# Altium schematic sheet Connector_Section.SchDoc
size A4; SheetNumber: 5; SheetTotal: 5
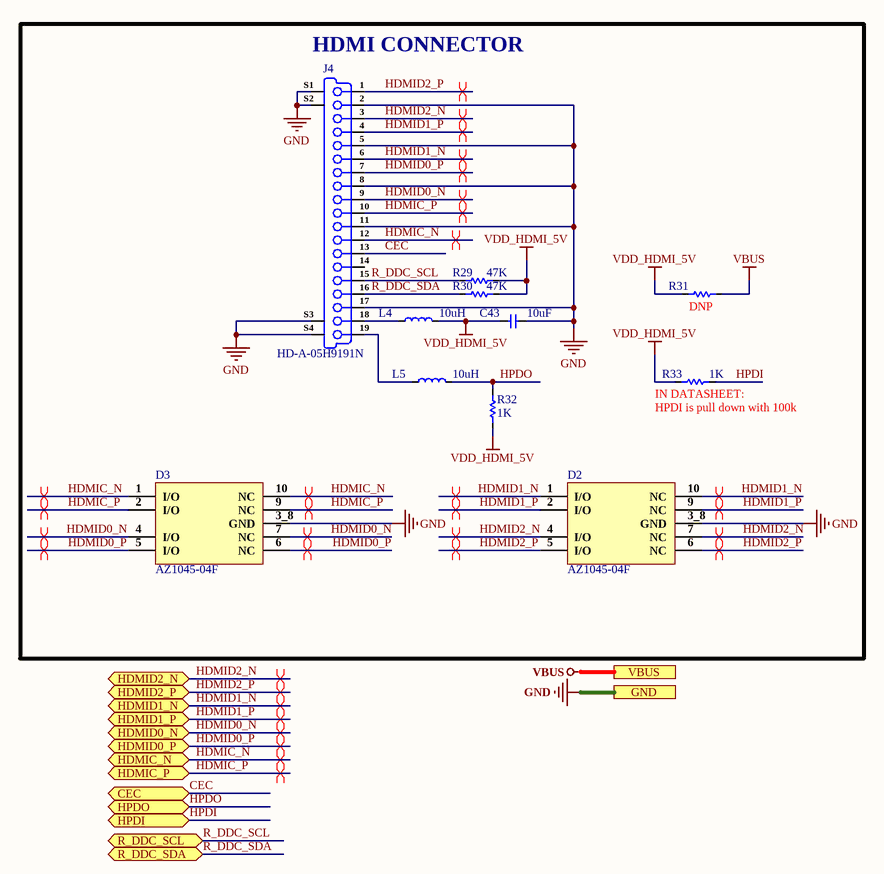
[diagram p0: Connector_Section.SchDoc]

## Parts
C43  10uF  [Cap-0603]
D2  AZ1045-04F  [AZ1045-04F]
D3  AZ1045-04F  [AZ1045-04F]
J4  HD-A-05H9191N  [HD-A-05H9191N]
L4  10uH  [IND-0603 (1608 Metric)]
L5  10uH  [IND-0603 (1608 Metric)]
R29  47K  [Res-0603]
R30  47K  [Res-0603]
R31  1K  [Res-0603]  (value not drawn)
R32  1K  [Res-0603]
R33  1K  [Res-0603]

## Ports
CEC (bidir, see Top_Sheet[3C], HDMI_to_MIPI_Section[1D]), GND (see Top_Sheet[3D], Controller_Section[1D], HDMI_to_MIPI_Section[1D], Power_Section[3C]), HDMIC_N (bidir, see Top_Sheet[3C], HDMI_to_MIPI_Section[1C]), HDMIC_P (bidir, see Top_Sheet[3C], HDMI_to_MIPI_Section[1D]), HDMID0_N (bidir, see Top_Sheet[3C], HDMI_to_MIPI_Section[1C]), HDMID0_P (bidir, see Top_Sheet[3C], HDMI_to_MIPI_Section[1C]), HDMID1_N (bidir, see Top_Sheet[3C], HDMI_to_MIPI_Section[1C]), HDMID1_P (bidir, see Top_Sheet[3C], HDMI_to_MIPI_Section[1C]), HDMID2_N (bidir, see Top_Sheet[3C], HDMI_to_MIPI_Section[1C]), HDMID2_P (bidir, see Top_Sheet[3C], HDMI_to_MIPI_Section[1C]), HPDI (bidir, see Top_Sheet[3C], HDMI_to_MIPI_Section[1D]), HPDO (bidir, see Top_Sheet[3C], HDMI_to_MIPI_Section[1D]), R_DDC_SCL (bidir, see Top_Sheet[3C], HDMI_to_MIPI_Section[1D]), R_DDC_SDA (bidir, see Top_Sheet[3C], HDMI_to_MIPI_Section[1D]), VBUS (see Top_Sheet[2C], Controller_Section[1D], Power_Section[3C])

## Nets
GND: C43.1 D2.3_8(GND) D3.3_8(GND) J4.2 J4.5 J4.8 J4.11 J4.17 J4.S1(Shield) J4.S2(Shield) J4.S3(Shield) J4.S4(Shield) ; port GND
VBUS: R31.1 ; port VBUS
VDD_HDMI_5V: C43.2 L4.2 R29.2 R30.2 R31.2 R32.2 R33.2
CEC: J4.13 ; port CEC
HDMIC_N: D3.1(I/O) D3.10(NC) J4.12 ; port HDMIC_N
HDMIC_P: D3.2(I/O) D3.9(NC) J4.10 ; port HDMIC_P
HDMID0_N: D3.4(I/O) D3.7(NC) J4.9 ; port HDMID0_N
HDMID0_P: D3.5(I/O) D3.6(NC) J4.7 ; port HDMID0_P
HDMID1_N: D2.1(I/O) D2.10(NC) J4.6 ; port HDMID1_N
HDMID1_P: D2.2(I/O) D2.9(NC) J4.4 ; port HDMID1_P
HDMID2_N: D2.4(I/O) D2.7(NC) J4.3 ; port HDMID2_N
HDMID2_P: D2.5(I/O) D2.6(NC) J4.1 ; port HDMID2_P
HPDI: R33.1 ; port HPDI
HPDO: L5.2 R32.1 ; port HPDO
R_DDC_SCL: J4.15 R29.1 ; port R_DDC_SCL
R_DDC_SDA: J4.16 R30.1 ; port R_DDC_SDA
NetJ4_18: J4.18 L4.1
NetJ4_19: J4.19 L5.1

Not connected (* = marked no-connect by the designer): J4 14

## Layout directives
differential pair; net class HDMI; differential pair class HDMI_Lines; rule Impedance Constraint [Min = 95.00    Max = 100.0    ]; rule Matched Net Lengths [Tolerance = 5mil]: HDMIC_N, HDMIC_P, HDMID0_N, HDMID0_P, HDMID1_N, HDMID1_P, HDMID2_N, HDMID2_P

## Notes on the sheet
- (near J4) HDMI CONNECTOR
- (near R31) DNP
- (near R33) IN DATASHEET:
- (near R33) HPDI is pull down with 100k
- File:
- Title:
- Date:
- Page
- Num:
- Total:
- Drawn By: Huzaifa Ali

## Library data of the parts
C43 = CGA0603X5R106K100JT: 10V 10uF X5R ±10% 0603 Multilayer Ceramic Capacitors MLCC - SMD/SMT ROHS; Manufacturer: HRE; ComponentLink1Description: LCSC; ComponentLink1URL: https://www.lcsc.com/product-detail/Multilayer-Ceramic-Capacitors-MLCC-SMD-SMT_HRE-CGA0603X5R106K100JT_C6119842.html; Manufacturer Part Number: CGA0603X5R106K100JT; Package: 0603; LCSC Part Number: C6119842; Item Type: Capacitor
D2 D3 = AZ1045-04F: DFN2510-10 Electrostatic and Surge Protection (TVS/ESD) ROHS; Manufacturer: TECH PUBLIC; Item Type: Diode; ComponentLink1Description: LCSC; ComponentLink1URL: https://www.lcsc.com/product-detail/Electrostatic-and-Surge-Protection-TVS-ESD_TECH-PUBLIC-AZ1045-04F_C2987152.html; Manufacturer Part Number: AZ1045-04F; LCSC Part Number: C2987152
J4 = HD-A-05H9191N: 19P Female HDMI Surface Mount，Right Angle 1 500mA -45℃~+85℃ SMD D-Sub/DVI/HDMI Connectors ROHS; Manufacturer: HanElectricity; Manufacturer Part Number: HD-A-05H9191N; Package: SMD; LCSC Part Number: C18213861; Item Type: HDMI; ComponentLink1Description: LCSC; ComponentLink1URL: https://www.lcsc.com/product-detail/D-Sub-DVI-HDMI-Connectors_HanElectricity-HD-A-05H9191N_C18213861.html
L4 L5 = MCL1608S100MT: 50mA 10uH ±20% 1.17Ω 0603 Inductors (SMD) ROHS; Manufacturer: SUNLORD; Manufacturer Part Number: MCL1608S100MT; Value: 10uH; Footprint: 0603; ComponentLink1Description: LCSC; ComponentLink1URL: https://www.lcsc.com/product-detail/Inductors-SMD_Sunlord-MCL1608S100MT_C51942.html; LCSC Part Number: C51942
R29 R30 = RC0603JR-0747KL: RES 47K OHM 5% 1/10W 0603; Manufacturer: Yageo; Resistance: 47kR; Power Rating: 100mW; Voltage Rating (DC): 50V; Temperature Coefficient: 100ppm/°C; Resistance Tolerance: 1%; Supplier 1: Arrow; Manufacturer Part Number: RC0603JR-0747KL; Stock 1: 599135; Pricing 1: 5000=0.0025, 10000=0.0022, 25000=0.0019, 1=0.0011, 6000=0.001 (USD); Case/Package: 0603; Number of Pins: 2; Case Code (Imperial): 0603; Case Code (Metric): 1608; Min Operating Temperature: -55°C; Max Operating Temperature: 155°C; Packaging: Tape and Reel; Tolerance: 5%; Voltage Rating: 50V; Package Quantity: 5000; Termination: SMD/SMT; Military Standard: Not; Composition: Thick Film; Length: 1.6mm; Height: 0.45mm; Width: 0.8mm; Depth: 0.8mm; REACH SVHC: No SVHC; Lead Free: Lead Free; ComponentLink1URL: http://www.farnell.com/datasheets/443971.pdf; ComponentLink1Description: http://www.farnell.com/datasheets/443971.pdf; ComponentLink2URL: http://www.mouser.com/catalog/specsheets/RC0603.pdf; ComponentLink2Description: http://www.mouser.com/catalog/specsheets/RC0603.pdf; Supplier Part Number 1: RC0603JR-0747KL; Supplier 2: Digi-Key; RoHS: Yes; Category: Chip SMD Resistors; Stock 2: 1087850; Pricing 2: 1=0.10000, 10=0.02300, 100=0.00930, 1000=0.00417, 2500=0.00362 (USD); Size Code: 0603; Number of Terminations: 2; Resistor Type: Thick Film; Features: Moisture Resistant; Series: RC; Max Power Dissipation: 100mW; Construction: Rectangular; RoHS Compliant: Yes; ComponentLink3URL: https://datasheet.ciiva.com/46395/443971-46395003.pdf?src-supplier=Element14; ComponentLink3Description: https://datasheet.ciiva.com/46395/443971-46395003.pdf?src-supplier=Element14; ComponentLink4URL: https://datasheet.ciiva.com/12558/rc0603-272842-12558744.pdf?src-supplier=Mouser; ComponentLink4Description: https://datasheet.ciiva.com/12558/rc0603-272842-12558744.pdf?src-supplier=Mouser; Supplier Part Number 2: 311-30.0KHRCT-ND; LCSC Part Number: C127447
R31-R33 = RC0603FR-071KL: RES SMD 1K OHM 1% 1/10W 0603; Manufacturer: Yageo; Resistance: 1kR; Temperature Coefficient: 100ppm/°C; Power Rating: 100mW; Voltage Rating: 50V; Item type: Resistor; ComponentLink1URL: https://www.verical.com/server-webapp/html/getDatasheet?partID=409289&src-supplier=Verical; ComponentLink1Description: https://www.verical.com/server-webapp/html/getDatasheet?partID=409289&src-supplier=Verical; Supplier 1: Digi-Key; Manufacturer Part Number: RC0603FR-071KL; Stock 1: 21472395; Pricing 1: 1=0.1, 10=0.023, 100=0.0094, 1000=0.0042, 2500=0.0037 (USD); Case/Package: 0603; Contact Plating: Tin,Matte; Case Code (Imperial): 0603; Case Code (Metric): 1608; Min Operating Temperature: -55°C; Max Operating Temperature: 155°C; Tolerance: 1%; Composition: Thick Film; Packaging: Tape and Reel; Termination: SMD/SMT; Military Standard: Not; Length: 1.6mm; Height: 0.45mm; Depth: 0.8mm; Radiation Hardening: No; REACH SVHC: No SVHC; Lead Free: Lead Free; ComponentLink2URL: http://documents.rs-components.com/techlib://itc_doclist_GB.htm?stockno=5048928&src-supplier=RSComponents; ComponentLink2Description: http://documents.rs-components.com/techlib://itc_doclist_GB.htm?stockno=5048928&src-supplier=RSComponents; ComponentLink3URL: http://www.yageo.com/documents/recent/PYu-RC0603_51_RoHS_L_4.pdf?src-supplier=Avnet+Europe; ComponentLink3Description: http://www.yageo.com/documents/recent/PYu-RC0603_51_RoHS_L_4.pdf?src-supplier=Avnet+Europe; ComponentLink4URL: http://www.farnell.com/datasheets/2167052.pdf?src-supplier=Element14; ComponentLink4Description: http://www.farnell.com/datasheets/2167052.pdf?src-supplier=Element14; ComponentLink5URL: http://www.farnell.com/datasheets/1868787.pdf?src-supplier=Element14; ComponentLink5Description: http://www.farnell.com/datasheets/1868787.pdf?src-supplier=Element14; ComponentLink6URL: http://www.yageo.com/documents/recent/PYu-RC_Group_51_RoHS_L_2.pdf?src-supplier=Avnet; ComponentLink6Description: http://www.yageo.com/documents/recent/PYu-RC_Group_51_RoHS_L_2.pdf?src-supplier=Avnet; ComponentLink7URL: https://www.verical.com/server-webapp/html/getDatasheet?partID=404327&src-supplier=Verical; ComponentLink7Description: https://www.verical.com/server-webapp/html/getDatasheet?partID=404327&src-supplier=Verical; ComponentLink8URL: http://www.farnell.com/datasheets/443971.pdf?src-supplier=Element14; ComponentLink8Description: http://www.farnell.com/datasheets/443971.pdf?src-supplier=Element14; Supplier Part Number 1: 311-1.00KHRDKR-ND; LCSC Part Number: C22548